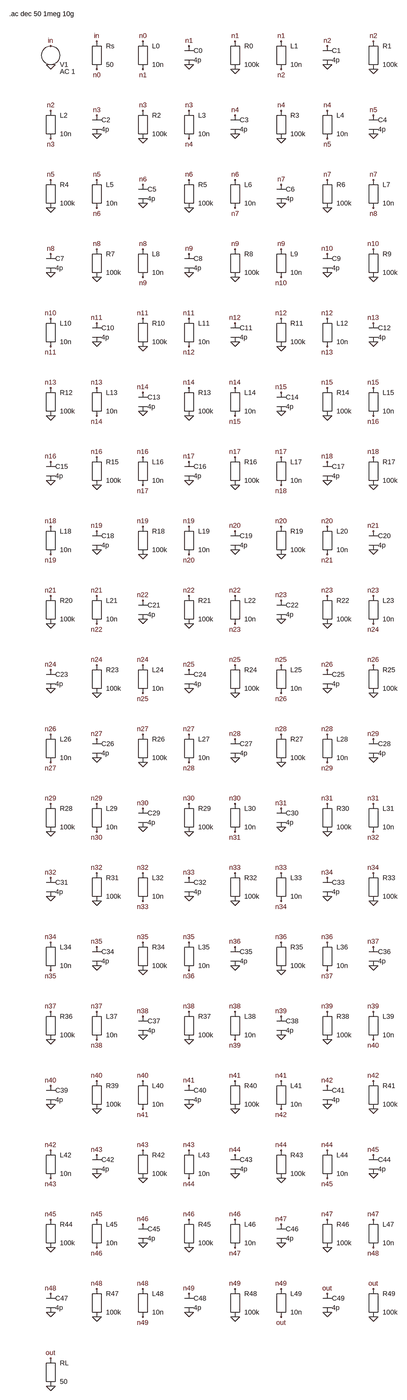
[diagram p0: schematic rlc_line_labelled.asc, whole sheet]
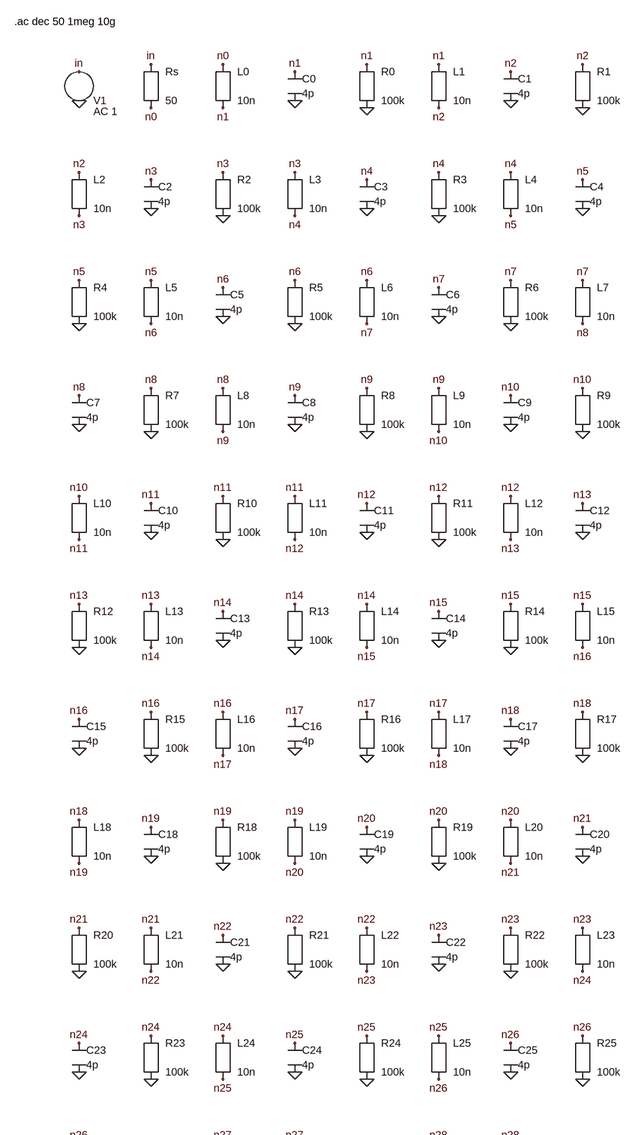
[diagram p1: schematic rlc_line_labelled.asc, part, row 1 of 2, column 1 of 1]
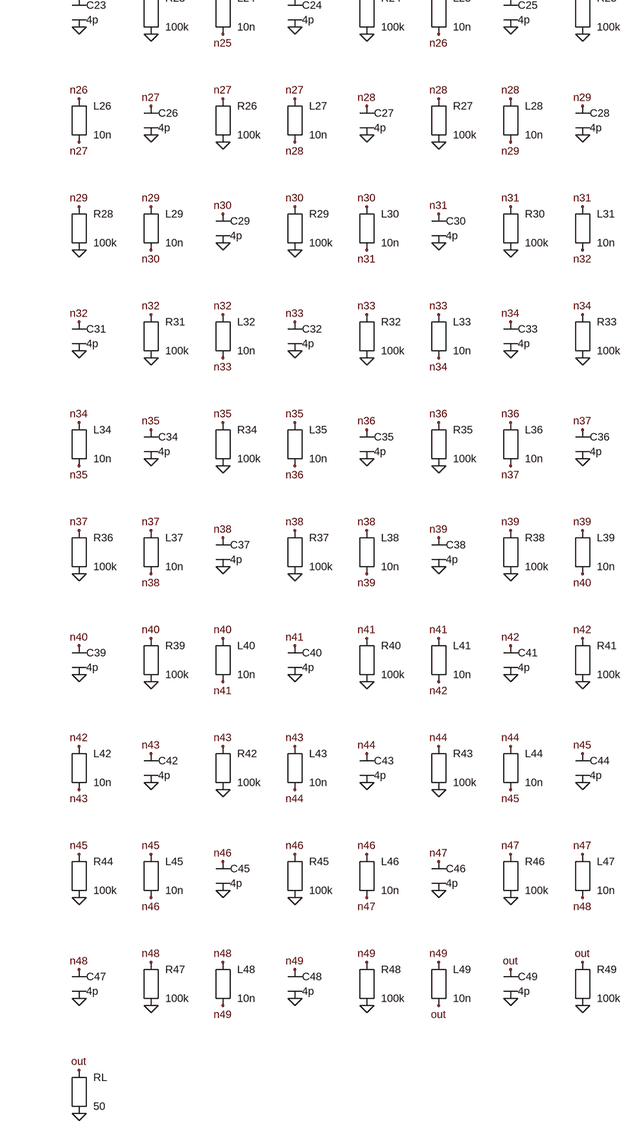
[diagram p2: schematic rlc_line_labelled.asc, part, row 2 of 2, column 1 of 1]
rlc_line_labelled.asc, the LTspice schematic file:
Version 4
SHEET 1 880 680
FLAG 160 128 in
FLAG 160 192 0
FLAG 320 112 in
FLAG 320 208 n0
FLAG 480 112 n0
FLAG 480 208 n1
FLAG 640 128 n1
FLAG 640 192 0
FLAG 800 112 n1
FLAG 800 208 0
FLAG 960 112 n1
FLAG 960 208 n2
FLAG 1120 128 n2
FLAG 1120 192 0
FLAG 1280 112 n2
FLAG 1280 208 0
FLAG 160 352 n2
FLAG 160 448 n3
FLAG 320 368 n3
FLAG 320 432 0
FLAG 480 352 n3
FLAG 480 448 0
FLAG 640 352 n3
FLAG 640 448 n4
FLAG 800 368 n4
FLAG 800 432 0
FLAG 960 352 n4
FLAG 960 448 0
FLAG 1120 352 n4
FLAG 1120 448 n5
FLAG 1280 368 n5
FLAG 1280 432 0
FLAG 160 592 n5
FLAG 160 688 0
FLAG 320 592 n5
FLAG 320 688 n6
FLAG 480 608 n6
FLAG 480 672 0
FLAG 640 592 n6
FLAG 640 688 0
FLAG 800 592 n6
FLAG 800 688 n7
FLAG 960 608 n7
FLAG 960 672 0
FLAG 1120 592 n7
FLAG 1120 688 0
FLAG 1280 592 n7
FLAG 1280 688 n8
FLAG 160 848 n8
FLAG 160 912 0
FLAG 320 832 n8
FLAG 320 928 0
FLAG 480 832 n8
FLAG 480 928 n9
FLAG 640 848 n9
FLAG 640 912 0
FLAG 800 832 n9
FLAG 800 928 0
FLAG 960 832 n9
FLAG 960 928 n10
FLAG 1120 848 n10
FLAG 1120 912 0
FLAG 1280 832 n10
FLAG 1280 928 0
FLAG 160 1072 n10
FLAG 160 1168 n11
FLAG 320 1088 n11
FLAG 320 1152 0
FLAG 480 1072 n11
FLAG 480 1168 0
FLAG 640 1072 n11
FLAG 640 1168 n12
FLAG 800 1088 n12
FLAG 800 1152 0
FLAG 960 1072 n12
FLAG 960 1168 0
FLAG 1120 1072 n12
FLAG 1120 1168 n13
FLAG 1280 1088 n13
FLAG 1280 1152 0
FLAG 160 1312 n13
FLAG 160 1408 0
FLAG 320 1312 n13
FLAG 320 1408 n14
FLAG 480 1328 n14
FLAG 480 1392 0
FLAG 640 1312 n14
FLAG 640 1408 0
FLAG 800 1312 n14
FLAG 800 1408 n15
FLAG 960 1328 n15
FLAG 960 1392 0
FLAG 1120 1312 n15
FLAG 1120 1408 0
FLAG 1280 1312 n15
FLAG 1280 1408 n16
FLAG 160 1568 n16
FLAG 160 1632 0
FLAG 320 1552 n16
FLAG 320 1648 0
FLAG 480 1552 n16
FLAG 480 1648 n17
FLAG 640 1568 n17
FLAG 640 1632 0
FLAG 800 1552 n17
FLAG 800 1648 0
FLAG 960 1552 n17
FLAG 960 1648 n18
FLAG 1120 1568 n18
FLAG 1120 1632 0
FLAG 1280 1552 n18
FLAG 1280 1648 0
FLAG 160 1792 n18
FLAG 160 1888 n19
FLAG 320 1808 n19
FLAG 320 1872 0
FLAG 480 1792 n19
FLAG 480 1888 0
FLAG 640 1792 n19
FLAG 640 1888 n20
FLAG 800 1808 n20
FLAG 800 1872 0
FLAG 960 1792 n20
FLAG 960 1888 0
FLAG 1120 1792 n20
FLAG 1120 1888 n21
FLAG 1280 1808 n21
FLAG 1280 1872 0
FLAG 160 2032 n21
FLAG 160 2128 0
FLAG 320 2032 n21
FLAG 320 2128 n22
FLAG 480 2048 n22
FLAG 480 2112 0
FLAG 640 2032 n22
FLAG 640 2128 0
FLAG 800 2032 n22
FLAG 800 2128 n23
FLAG 960 2048 n23
FLAG 960 2112 0
FLAG 1120 2032 n23
FLAG 1120 2128 0
FLAG 1280 2032 n23
FLAG 1280 2128 n24
FLAG 160 2288 n24
FLAG 160 2352 0
FLAG 320 2272 n24
FLAG 320 2368 0
FLAG 480 2272 n24
FLAG 480 2368 n25
FLAG 640 2288 n25
FLAG 640 2352 0
FLAG 800 2272 n25
FLAG 800 2368 0
FLAG 960 2272 n25
FLAG 960 2368 n26
FLAG 1120 2288 n26
FLAG 1120 2352 0
FLAG 1280 2272 n26
FLAG 1280 2368 0
FLAG 160 2512 n26
FLAG 160 2608 n27
FLAG 320 2528 n27
FLAG 320 2592 0
FLAG 480 2512 n27
FLAG 480 2608 0
FLAG 640 2512 n27
FLAG 640 2608 n28
FLAG 800 2528 n28
FLAG 800 2592 0
FLAG 960 2512 n28
FLAG 960 2608 0
FLAG 1120 2512 n28
FLAG 1120 2608 n29
FLAG 1280 2528 n29
FLAG 1280 2592 0
FLAG 160 2752 n29
FLAG 160 2848 0
FLAG 320 2752 n29
FLAG 320 2848 n30
FLAG 480 2768 n30
FLAG 480 2832 0
FLAG 640 2752 n30
FLAG 640 2848 0
FLAG 800 2752 n30
FLAG 800 2848 n31
FLAG 960 2768 n31
FLAG 960 2832 0
FLAG 1120 2752 n31
FLAG 1120 2848 0
FLAG 1280 2752 n31
FLAG 1280 2848 n32
FLAG 160 3008 n32
FLAG 160 3072 0
FLAG 320 2992 n32
FLAG 320 3088 0
FLAG 480 2992 n32
FLAG 480 3088 n33
FLAG 640 3008 n33
FLAG 640 3072 0
FLAG 800 2992 n33
FLAG 800 3088 0
FLAG 960 2992 n33
FLAG 960 3088 n34
FLAG 1120 3008 n34
FLAG 1120 3072 0
FLAG 1280 2992 n34
FLAG 1280 3088 0
FLAG 160 3232 n34
FLAG 160 3328 n35
FLAG 320 3248 n35
FLAG 320 3312 0
FLAG 480 3232 n35
FLAG 480 3328 0
FLAG 640 3232 n35
FLAG 640 3328 n36
FLAG 800 3248 n36
FLAG 800 3312 0
FLAG 960 3232 n36
FLAG 960 3328 0
FLAG 1120 3232 n36
FLAG 1120 3328 n37
FLAG 1280 3248 n37
FLAG 1280 3312 0
FLAG 160 3472 n37
FLAG 160 3568 0
FLAG 320 3472 n37
FLAG 320 3568 n38
FLAG 480 3488 n38
FLAG 480 3552 0
FLAG 640 3472 n38
FLAG 640 3568 0
FLAG 800 3472 n38
FLAG 800 3568 n39
FLAG 960 3488 n39
FLAG 960 3552 0
FLAG 1120 3472 n39
FLAG 1120 3568 0
FLAG 1280 3472 n39
FLAG 1280 3568 n40
FLAG 160 3728 n40
FLAG 160 3792 0
FLAG 320 3712 n40
FLAG 320 3808 0
FLAG 480 3712 n40
FLAG 480 3808 n41
FLAG 640 3728 n41
FLAG 640 3792 0
FLAG 800 3712 n41
FLAG 800 3808 0
FLAG 960 3712 n41
FLAG 960 3808 n42
FLAG 1120 3728 n42
FLAG 1120 3792 0
FLAG 1280 3712 n42
FLAG 1280 3808 0
FLAG 160 3952 n42
FLAG 160 4048 n43
FLAG 320 3968 n43
FLAG 320 4032 0
FLAG 480 3952 n43
FLAG 480 4048 0
FLAG 640 3952 n43
FLAG 640 4048 n44
FLAG 800 3968 n44
FLAG 800 4032 0
FLAG 960 3952 n44
FLAG 960 4048 0
FLAG 1120 3952 n44
FLAG 1120 4048 n45
FLAG 1280 3968 n45
FLAG 1280 4032 0
FLAG 160 4192 n45
FLAG 160 4288 0
FLAG 320 4192 n45
FLAG 320 4288 n46
FLAG 480 4208 n46
FLAG 480 4272 0
FLAG 640 4192 n46
FLAG 640 4288 0
FLAG 800 4192 n46
FLAG 800 4288 n47
FLAG 960 4208 n47
FLAG 960 4272 0
FLAG 1120 4192 n47
FLAG 1120 4288 0
FLAG 1280 4192 n47
FLAG 1280 4288 n48
FLAG 160 4448 n48
FLAG 160 4512 0
FLAG 320 4432 n48
FLAG 320 4528 0
FLAG 480 4432 n48
FLAG 480 4528 n49
FLAG 640 4448 n49
FLAG 640 4512 0
FLAG 800 4432 n49
FLAG 800 4528 0
FLAG 960 4432 n49
FLAG 960 4528 out
FLAG 1120 4448 out
FLAG 1120 4512 0
FLAG 1280 4432 out
FLAG 1280 4528 0
FLAG 160 4672 out
FLAG 160 4768 0
SYMBOL voltage 160 160 R0
SYMATTR InstName V1
SYMATTR Value AC 1
SYMBOL res 320 160 R0
SYMATTR InstName Rs
SYMATTR Value 50
SYMBOL ind 480 160 R0
SYMATTR InstName L0
SYMATTR Value 10n
SYMBOL cap 640 160 R0
SYMATTR InstName C0
SYMATTR Value 4p
SYMBOL res 800 160 R0
SYMATTR InstName R0
SYMATTR Value 100k
SYMBOL ind 960 160 R0
SYMATTR InstName L1
SYMATTR Value 10n
SYMBOL cap 1120 160 R0
SYMATTR InstName C1
SYMATTR Value 4p
SYMBOL res 1280 160 R0
SYMATTR InstName R1
SYMATTR Value 100k
SYMBOL ind 160 400 R0
SYMATTR InstName L2
SYMATTR Value 10n
SYMBOL cap 320 400 R0
SYMATTR InstName C2
SYMATTR Value 4p
SYMBOL res 480 400 R0
SYMATTR InstName R2
SYMATTR Value 100k
SYMBOL ind 640 400 R0
SYMATTR InstName L3
SYMATTR Value 10n
SYMBOL cap 800 400 R0
SYMATTR InstName C3
SYMATTR Value 4p
SYMBOL res 960 400 R0
SYMATTR InstName R3
SYMATTR Value 100k
SYMBOL ind 1120 400 R0
SYMATTR InstName L4
SYMATTR Value 10n
SYMBOL cap 1280 400 R0
SYMATTR InstName C4
SYMATTR Value 4p
SYMBOL res 160 640 R0
SYMATTR InstName R4
SYMATTR Value 100k
SYMBOL ind 320 640 R0
SYMATTR InstName L5
SYMATTR Value 10n
SYMBOL cap 480 640 R0
SYMATTR InstName C5
SYMATTR Value 4p
SYMBOL res 640 640 R0
SYMATTR InstName R5
SYMATTR Value 100k
SYMBOL ind 800 640 R0
SYMATTR InstName L6
SYMATTR Value 10n
SYMBOL cap 960 640 R0
SYMATTR InstName C6
SYMATTR Value 4p
SYMBOL res 1120 640 R0
SYMATTR InstName R6
SYMATTR Value 100k
SYMBOL ind 1280 640 R0
SYMATTR InstName L7
SYMATTR Value 10n
SYMBOL cap 160 880 R0
SYMATTR InstName C7
SYMATTR Value 4p
SYMBOL res 320 880 R0
SYMATTR InstName R7
SYMATTR Value 100k
SYMBOL ind 480 880 R0
SYMATTR InstName L8
SYMATTR Value 10n
SYMBOL cap 640 880 R0
SYMATTR InstName C8
SYMATTR Value 4p
SYMBOL res 800 880 R0
SYMATTR InstName R8
SYMATTR Value 100k
SYMBOL ind 960 880 R0
SYMATTR InstName L9
SYMATTR Value 10n
SYMBOL cap 1120 880 R0
SYMATTR InstName C9
SYMATTR Value 4p
SYMBOL res 1280 880 R0
SYMATTR InstName R9
SYMATTR Value 100k
SYMBOL ind 160 1120 R0
SYMATTR InstName L10
SYMATTR Value 10n
SYMBOL cap 320 1120 R0
SYMATTR InstName C10
SYMATTR Value 4p
SYMBOL res 480 1120 R0
SYMATTR InstName R10
SYMATTR Value 100k
SYMBOL ind 640 1120 R0
SYMATTR InstName L11
SYMATTR Value 10n
SYMBOL cap 800 1120 R0
SYMATTR InstName C11
SYMATTR Value 4p
SYMBOL res 960 1120 R0
SYMATTR InstName R11
SYMATTR Value 100k
SYMBOL ind 1120 1120 R0
SYMATTR InstName L12
SYMATTR Value 10n
SYMBOL cap 1280 1120 R0
SYMATTR InstName C12
SYMATTR Value 4p
SYMBOL res 160 1360 R0
SYMATTR InstName R12
SYMATTR Value 100k
SYMBOL ind 320 1360 R0
SYMATTR InstName L13
SYMATTR Value 10n
SYMBOL cap 480 1360 R0
SYMATTR InstName C13
SYMATTR Value 4p
SYMBOL res 640 1360 R0
SYMATTR InstName R13
SYMATTR Value 100k
SYMBOL ind 800 1360 R0
SYMATTR InstName L14
SYMATTR Value 10n
SYMBOL cap 960 1360 R0
SYMATTR InstName C14
SYMATTR Value 4p
SYMBOL res 1120 1360 R0
SYMATTR InstName R14
SYMATTR Value 100k
SYMBOL ind 1280 1360 R0
SYMATTR InstName L15
SYMATTR Value 10n
SYMBOL cap 160 1600 R0
SYMATTR InstName C15
SYMATTR Value 4p
SYMBOL res 320 1600 R0
SYMATTR InstName R15
SYMATTR Value 100k
SYMBOL ind 480 1600 R0
SYMATTR InstName L16
SYMATTR Value 10n
SYMBOL cap 640 1600 R0
SYMATTR InstName C16
SYMATTR Value 4p
SYMBOL res 800 1600 R0
SYMATTR InstName R16
SYMATTR Value 100k
SYMBOL ind 960 1600 R0
SYMATTR InstName L17
SYMATTR Value 10n
SYMBOL cap 1120 1600 R0
SYMATTR InstName C17
SYMATTR Value 4p
SYMBOL res 1280 1600 R0
SYMATTR InstName R17
SYMATTR Value 100k
SYMBOL ind 160 1840 R0
SYMATTR InstName L18
SYMATTR Value 10n
SYMBOL cap 320 1840 R0
SYMATTR InstName C18
SYMATTR Value 4p
SYMBOL res 480 1840 R0
SYMATTR InstName R18
SYMATTR Value 100k
SYMBOL ind 640 1840 R0
SYMATTR InstName L19
SYMATTR Value 10n
SYMBOL cap 800 1840 R0
SYMATTR InstName C19
SYMATTR Value 4p
SYMBOL res 960 1840 R0
SYMATTR InstName R19
SYMATTR Value 100k
SYMBOL ind 1120 1840 R0
SYMATTR InstName L20
SYMATTR Value 10n
SYMBOL cap 1280 1840 R0
SYMATTR InstName C20
SYMATTR Value 4p
SYMBOL res 160 2080 R0
SYMATTR InstName R20
SYMATTR Value 100k
SYMBOL ind 320 2080 R0
SYMATTR InstName L21
SYMATTR Value 10n
SYMBOL cap 480 2080 R0
SYMATTR InstName C21
SYMATTR Value 4p
SYMBOL res 640 2080 R0
SYMATTR InstName R21
SYMATTR Value 100k
SYMBOL ind 800 2080 R0
SYMATTR InstName L22
SYMATTR Value 10n
SYMBOL cap 960 2080 R0
SYMATTR InstName C22
SYMATTR Value 4p
SYMBOL res 1120 2080 R0
SYMATTR InstName R22
SYMATTR Value 100k
SYMBOL ind 1280 2080 R0
SYMATTR InstName L23
SYMATTR Value 10n
SYMBOL cap 160 2320 R0
SYMATTR InstName C23
SYMATTR Value 4p
SYMBOL res 320 2320 R0
SYMATTR InstName R23
SYMATTR Value 100k
SYMBOL ind 480 2320 R0
SYMATTR InstName L24
SYMATTR Value 10n
SYMBOL cap 640 2320 R0
SYMATTR InstName C24
SYMATTR Value 4p
SYMBOL res 800 2320 R0
SYMATTR InstName R24
SYMATTR Value 100k
SYMBOL ind 960 2320 R0
SYMATTR InstName L25
SYMATTR Value 10n
SYMBOL cap 1120 2320 R0
SYMATTR InstName C25
SYMATTR Value 4p
SYMBOL res 1280 2320 R0
SYMATTR InstName R25
SYMATTR Value 100k
SYMBOL ind 160 2560 R0
SYMATTR InstName L26
SYMATTR Value 10n
SYMBOL cap 320 2560 R0
SYMATTR InstName C26
SYMATTR Value 4p
SYMBOL res 480 2560 R0
SYMATTR InstName R26
SYMATTR Value 100k
SYMBOL ind 640 2560 R0
SYMATTR InstName L27
SYMATTR Value 10n
SYMBOL cap 800 2560 R0
SYMATTR InstName C27
SYMATTR Value 4p
SYMBOL res 960 2560 R0
SYMATTR InstName R27
SYMATTR Value 100k
SYMBOL ind 1120 2560 R0
SYMATTR InstName L28
SYMATTR Value 10n
SYMBOL cap 1280 2560 R0
SYMATTR InstName C28
SYMATTR Value 4p
SYMBOL res 160 2800 R0
SYMATTR InstName R28
SYMATTR Value 100k
SYMBOL ind 320 2800 R0
SYMATTR InstName L29
SYMATTR Value 10n
SYMBOL cap 480 2800 R0
SYMATTR InstName C29
SYMATTR Value 4p
SYMBOL res 640 2800 R0
SYMATTR InstName R29
SYMATTR Value 100k
SYMBOL ind 800 2800 R0
SYMATTR InstName L30
SYMATTR Value 10n
SYMBOL cap 960 2800 R0
SYMATTR InstName C30
SYMATTR Value 4p
SYMBOL res 1120 2800 R0
SYMATTR InstName R30
SYMATTR Value 100k
SYMBOL ind 1280 2800 R0
SYMATTR InstName L31
SYMATTR Value 10n
SYMBOL cap 160 3040 R0
SYMATTR InstName C31
SYMATTR Value 4p
SYMBOL res 320 3040 R0
SYMATTR InstName R31
SYMATTR Value 100k
SYMBOL ind 480 3040 R0
SYMATTR InstName L32
SYMATTR Value 10n
SYMBOL cap 640 3040 R0
SYMATTR InstName C32
SYMATTR Value 4p
SYMBOL res 800 3040 R0
SYMATTR InstName R32
SYMATTR Value 100k
SYMBOL ind 960 3040 R0
SYMATTR InstName L33
SYMATTR Value 10n
SYMBOL cap 1120 3040 R0
SYMATTR InstName C33
SYMATTR Value 4p
SYMBOL res 1280 3040 R0
SYMATTR InstName R33
SYMATTR Value 100k
SYMBOL ind 160 3280 R0
SYMATTR InstName L34
SYMATTR Value 10n
SYMBOL cap 320 3280 R0
SYMATTR InstName C34
SYMATTR Value 4p
SYMBOL res 480 3280 R0
SYMATTR InstName R34
SYMATTR Value 100k
SYMBOL ind 640 3280 R0
SYMATTR InstName L35
SYMATTR Value 10n
SYMBOL cap 800 3280 R0
SYMATTR InstName C35
SYMATTR Value 4p
SYMBOL res 960 3280 R0
SYMATTR InstName R35
SYMATTR Value 100k
SYMBOL ind 1120 3280 R0
SYMATTR InstName L36
SYMATTR Value 10n
SYMBOL cap 1280 3280 R0
SYMATTR InstName C36
SYMATTR Value 4p
SYMBOL res 160 3520 R0
SYMATTR InstName R36
SYMATTR Value 100k
SYMBOL ind 320 3520 R0
SYMATTR InstName L37
SYMATTR Value 10n
SYMBOL cap 480 3520 R0
SYMATTR InstName C37
SYMATTR Value 4p
SYMBOL res 640 3520 R0
SYMATTR InstName R37
SYMATTR Value 100k
SYMBOL ind 800 3520 R0
SYMATTR InstName L38
SYMATTR Value 10n
SYMBOL cap 960 3520 R0
SYMATTR InstName C38
SYMATTR Value 4p
SYMBOL res 1120 3520 R0
SYMATTR InstName R38
SYMATTR Value 100k
SYMBOL ind 1280 3520 R0
SYMATTR InstName L39
SYMATTR Value 10n
SYMBOL cap 160 3760 R0
SYMATTR InstName C39
SYMATTR Value 4p
SYMBOL res 320 3760 R0
SYMATTR InstName R39
SYMATTR Value 100k
SYMBOL ind 480 3760 R0
SYMATTR InstName L40
SYMATTR Value 10n
SYMBOL cap 640 3760 R0
SYMATTR InstName C40
SYMATTR Value 4p
SYMBOL res 800 3760 R0
SYMATTR InstName R40
SYMATTR Value 100k
SYMBOL ind 960 3760 R0
SYMATTR InstName L41
SYMATTR Value 10n
SYMBOL cap 1120 3760 R0
SYMATTR InstName C41
SYMATTR Value 4p
SYMBOL res 1280 3760 R0
SYMATTR InstName R41
SYMATTR Value 100k
SYMBOL ind 160 4000 R0
SYMATTR InstName L42
SYMATTR Value 10n
SYMBOL cap 320 4000 R0
SYMATTR InstName C42
SYMATTR Value 4p
SYMBOL res 480 4000 R0
SYMATTR InstName R42
SYMATTR Value 100k
SYMBOL ind 640 4000 R0
SYMATTR InstName L43
SYMATTR Value 10n
SYMBOL cap 800 4000 R0
SYMATTR InstName C43
SYMATTR Value 4p
SYMBOL res 960 4000 R0
SYMATTR InstName R43
SYMATTR Value 100k
SYMBOL ind 1120 4000 R0
SYMATTR InstName L44
SYMATTR Value 10n
SYMBOL cap 1280 4000 R0
SYMATTR InstName C44
SYMATTR Value 4p
SYMBOL res 160 4240 R0
SYMATTR InstName R44
SYMATTR Value 100k
SYMBOL ind 320 4240 R0
SYMATTR InstName L45
SYMATTR Value 10n
SYMBOL cap 480 4240 R0
SYMATTR InstName C45
SYMATTR Value 4p
SYMBOL res 640 4240 R0
SYMATTR InstName R45
SYMATTR Value 100k
SYMBOL ind 800 4240 R0
SYMATTR InstName L46
SYMATTR Value 10n
SYMBOL cap 960 4240 R0
SYMATTR InstName C46
SYMATTR Value 4p
SYMBOL res 1120 4240 R0
SYMATTR InstName R46
SYMATTR Value 100k
SYMBOL ind 1280 4240 R0
SYMATTR InstName L47
SYMATTR Value 10n
SYMBOL cap 160 4480 R0
SYMATTR InstName C47
SYMATTR Value 4p
SYMBOL res 320 4480 R0
SYMATTR InstName R47
SYMATTR Value 100k
SYMBOL ind 480 4480 R0
SYMATTR InstName L48
SYMATTR Value 10n
SYMBOL cap 640 4480 R0
SYMATTR InstName C48
SYMATTR Value 4p
SYMBOL res 800 4480 R0
SYMATTR InstName R48
SYMATTR Value 100k
SYMBOL ind 960 4480 R0
SYMATTR InstName L49
SYMATTR Value 10n
SYMBOL cap 1120 4480 R0
SYMATTR InstName C49
SYMATTR Value 4p
SYMBOL res 1280 4480 R0
SYMATTR InstName R49
SYMATTR Value 100k
SYMBOL res 160 4720 R0
SYMATTR InstName RL
SYMATTR Value 50
TEXT 16 16 Left 2 !.ac dec 50 1meg 10g

The netlist it stands for:
* rlc_line_labelled.asc
V1 in 0 AC 1
Rs in n0 50
L0 n0 n1 10n
C0 n1 0 4p
R0 n1 0 100k
L1 n1 n2 10n
C1 n2 0 4p
R1 n2 0 100k
L2 n2 n3 10n
C2 n3 0 4p
R2 n3 0 100k
L3 n3 n4 10n
C3 n4 0 4p
R3 n4 0 100k
L4 n4 n5 10n
C4 n5 0 4p
R4 n5 0 100k
L5 n5 n6 10n
C5 n6 0 4p
R5 n6 0 100k
L6 n6 n7 10n
C6 n7 0 4p
R6 n7 0 100k
L7 n7 n8 10n
C7 n8 0 4p
R7 n8 0 100k
L8 n8 n9 10n
C8 n9 0 4p
R8 n9 0 100k
L9 n9 n10 10n
C9 n10 0 4p
R9 n10 0 100k
L10 n10 n11 10n
C10 n11 0 4p
R10 n11 0 100k
L11 n11 n12 10n
C11 n12 0 4p
R11 n12 0 100k
L12 n12 n13 10n
C12 n13 0 4p
R12 n13 0 100k
L13 n13 n14 10n
C13 n14 0 4p
R13 n14 0 100k
L14 n14 n15 10n
C14 n15 0 4p
R14 n15 0 100k
L15 n15 n16 10n
C15 n16 0 4p
R15 n16 0 100k
L16 n16 n17 10n
C16 n17 0 4p
R16 n17 0 100k
L17 n17 n18 10n
C17 n18 0 4p
R17 n18 0 100k
L18 n18 n19 10n
C18 n19 0 4p
R18 n19 0 100k
L19 n19 n20 10n
C19 n20 0 4p
R19 n20 0 100k
L20 n20 n21 10n
C20 n21 0 4p
R20 n21 0 100k
L21 n21 n22 10n
C21 n22 0 4p
R21 n22 0 100k
L22 n22 n23 10n
C22 n23 0 4p
R22 n23 0 100k
L23 n23 n24 10n
C23 n24 0 4p
R23 n24 0 100k
L24 n24 n25 10n
C24 n25 0 4p
R24 n25 0 100k
L25 n25 n26 10n
C25 n26 0 4p
R25 n26 0 100k
L26 n26 n27 10n
C26 n27 0 4p
R26 n27 0 100k
L27 n27 n28 10n
C27 n28 0 4p
R27 n28 0 100k
L28 n28 n29 10n
C28 n29 0 4p
R28 n29 0 100k
L29 n29 n30 10n
C29 n30 0 4p
R29 n30 0 100k
L30 n30 n31 10n
C30 n31 0 4p
R30 n31 0 100k
L31 n31 n32 10n
C31 n32 0 4p
R31 n32 0 100k
L32 n32 n33 10n
C32 n33 0 4p
R32 n33 0 100k
L33 n33 n34 10n
C33 n34 0 4p
R33 n34 0 100k
L34 n34 n35 10n
C34 n35 0 4p
R34 n35 0 100k
L35 n35 n36 10n
C35 n36 0 4p
R35 n36 0 100k
L36 n36 n37 10n
C36 n37 0 4p
R36 n37 0 100k
L37 n37 n38 10n
C37 n38 0 4p
R37 n38 0 100k
L38 n38 n39 10n
C38 n39 0 4p
R38 n39 0 100k
L39 n39 n40 10n
C39 n40 0 4p
R39 n40 0 100k
L40 n40 n41 10n
C40 n41 0 4p
R40 n41 0 100k
L41 n41 n42 10n
C41 n42 0 4p
R41 n42 0 100k
L42 n42 n43 10n
C42 n43 0 4p
R42 n43 0 100k
L43 n43 n44 10n
C43 n44 0 4p
R43 n44 0 100k
L44 n44 n45 10n
C44 n45 0 4p
R44 n45 0 100k
L45 n45 n46 10n
C45 n46 0 4p
R45 n46 0 100k
L46 n46 n47 10n
C46 n47 0 4p
R46 n47 0 100k
L47 n47 n48 10n
C47 n48 0 4p
R47 n48 0 100k
L48 n48 n49 10n
C48 n49 0 4p
R48 n49 0 100k
L49 n49 out 10n
C49 out 0 4p
R49 out 0 100k
RL out 0 50
.ac dec 50 1meg 10g
.backanno
.end